# EAGLE design untitled (EAGLE 7.6.0)

## Sheet 1 of 2
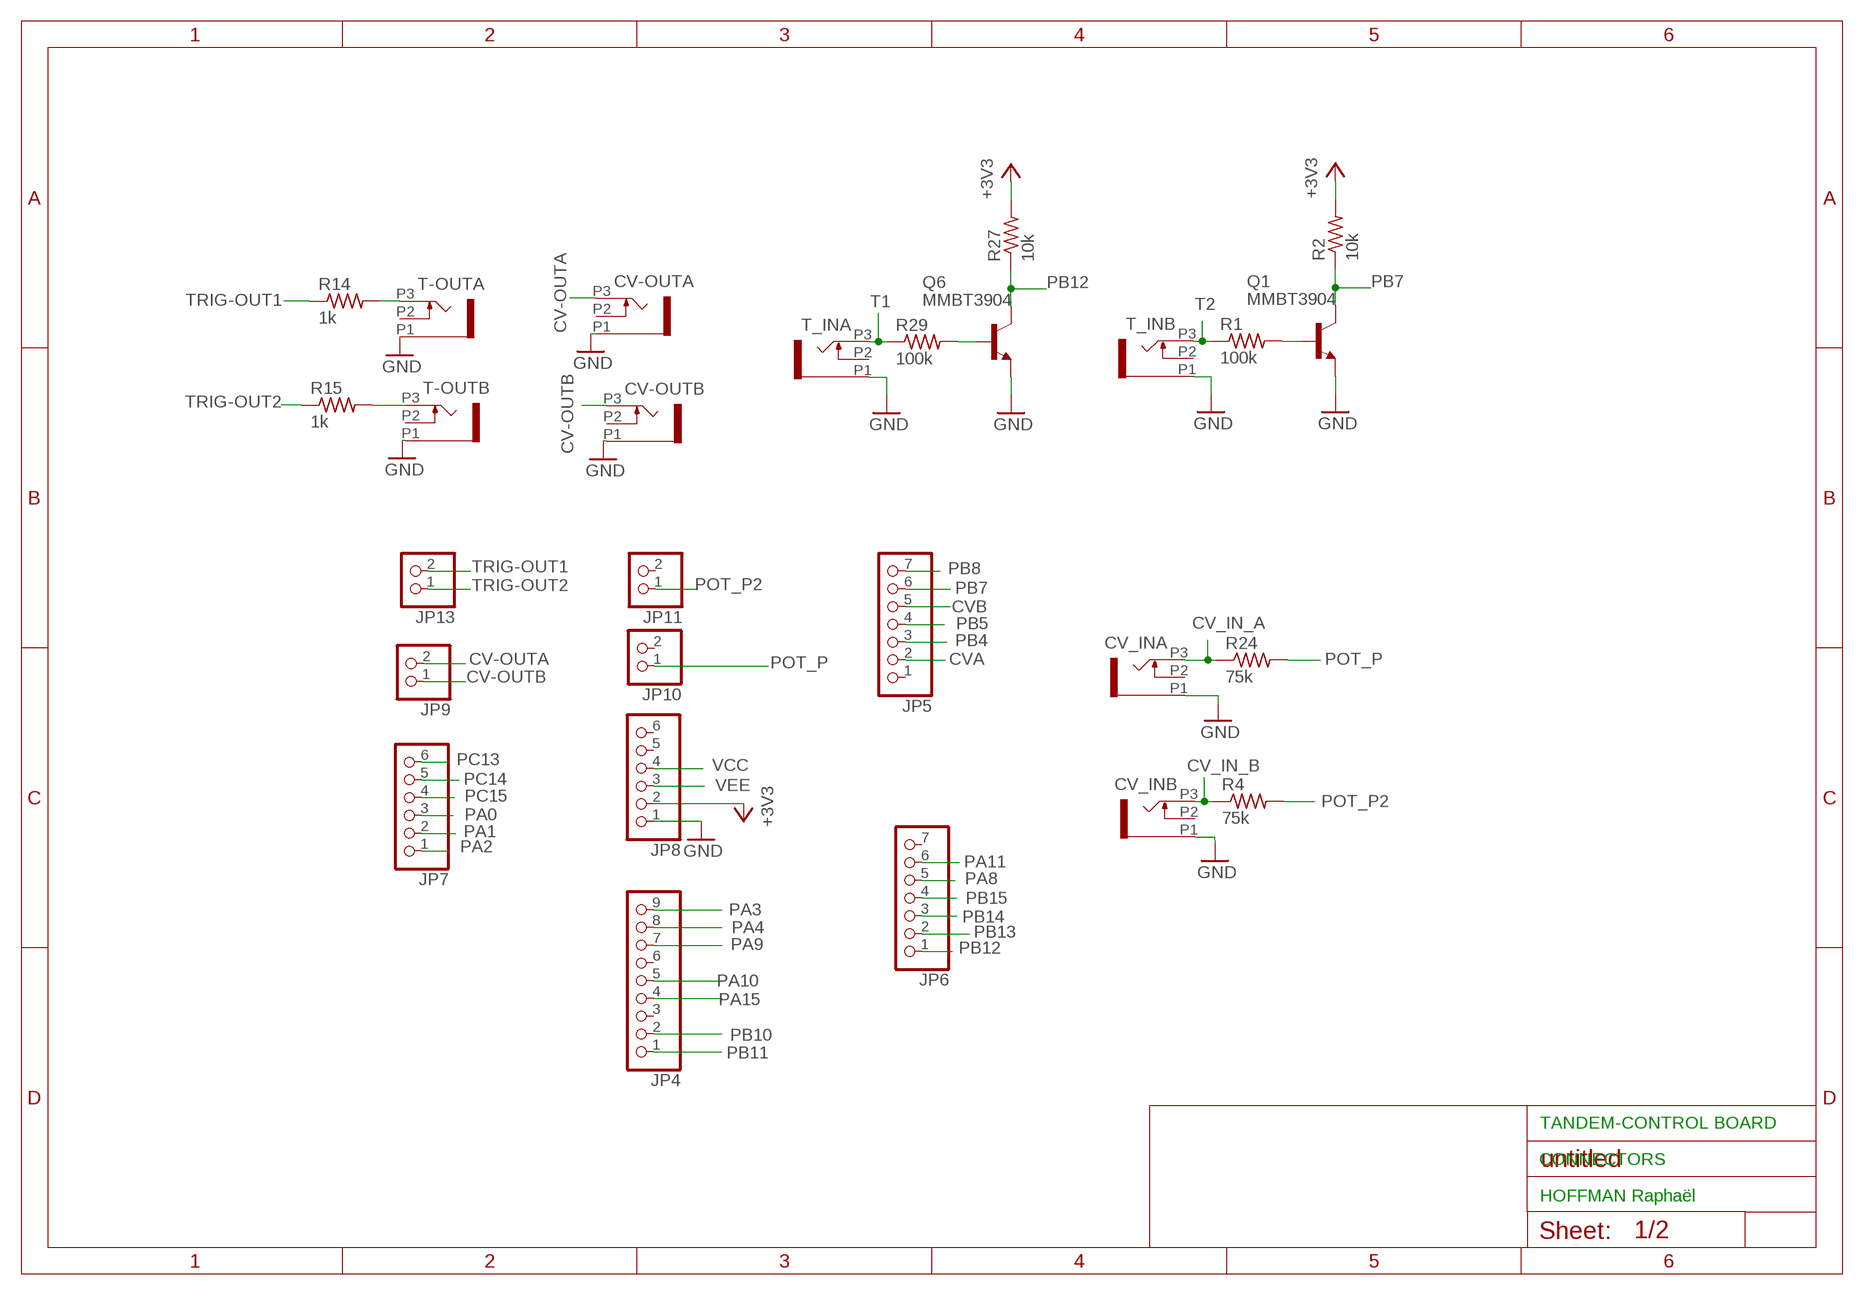
[diagram p0: schematic, sheet 1]

### Parts
CV-OUTA  PJ301_THONKICONN6  [WQP_PJ_301M6]
CV-OUTB  PJ301_THONKICONN6  [WQP_PJ_301M6]
CV_INA  PJ301_THONKICONN6  [WQP_PJ_301M6]
CV_INB  PJ301_THONKICONN6  [WQP_PJ_301M6]
JP4  PINHD-1X9  [1X09-BIG]
JP5  PINHD-1X7  [1X07]
JP6  PINHD-1X7  [1X07]
JP7  PINHD-1X6  [1X06]
JP8  PINHD-1X6  [1X06]
JP9  PINHD-1X2  [1X02]
JP10  PINHD-1X2  [1X02]
JP11  PINHD-1X2  [1X02]
JP13  PINHD-1X2  [1X02]
Q1  MMBT3904  MMBT3904LT1-NPN-SOT23-BEC  [SOT23-BEC]
Q6  MMBT3904  MMBT3904LT1-NPN-SOT23-BEC  [SOT23-BEC]
R1  100k  R-US_R0603  [R0603]
R2  10k  R-US_R0603  [R0603]
R4  75k  R-US_R0603  [R0603]
R14  1k  R-US_R0603  [R0603]
R15  1k  R-US_R0603  [R0603]
R24  75k  R-US_R0603  [R0603]
R27  10k  R-US_R0603  [R0603]
R29  100k  R-US_R0603  [R0603]
T-OUTA  PJ301_THONKICONN6  [WQP_PJ_301M6]
T-OUTB  PJ301_THONKICONN6  [WQP_PJ_301M6]
T_INA  PJ301_THONKICONN6  [WQP_PJ_301M6]
T_INB  PJ301_THONKICONN6  [WQP_PJ_301M6]

### Nets
+3V3: JP8.2 R2.2 R27.2 ; also sheet 2
CV-OUTA: CV-OUTA.P3 JP9.2
CV-OUTB: CV-OUTB.P3 JP9.1
CV_IN_A: CV_INA.P3 R24.1 ; also sheet 2
CV_IN_B: CV_INB.P3 R4.1 ; also sheet 2
CVA: JP5.2 ; also sheet 2
CVB: JP5.5 ; also sheet 2
GND [supply]: CV-OUTA.P1 CV-OUTB.P1 CV_INA.P1 CV_INB.P1 JP8.1 Q1.E Q6.E T-OUTA.P1 T-OUTB.P1 T_INA.P1 T_INB.P1 ; also sheet 2
N$2: Q1.B R1.2
N$10: R14.2 T-OUTA.P3
N$15: R15.2 T-OUTB.P3
N$66: Q6.B R29.2
PA0: JP7.3 ; also sheet 2
PA1: JP7.2 ; also sheet 2
PA2: JP7.1 ; also sheet 2
PA3: JP4.9
PA4: JP4.8 ; also sheet 2
PA8: JP6.5 ; also sheet 2
PA9: JP4.7 ; also sheet 2
PA10: JP4.5 ; also sheet 2
PA11: JP6.6 ; also sheet 2
PA15: JP4.4 ; also sheet 2
PB4: JP5.3 ; also sheet 2
PB5: JP5.4 ; also sheet 2
PB7: JP5.6 Q1.C R2.1
PB8: JP5.7 ; also sheet 2
PB10: JP4.2 ; also sheet 2
PB11: JP4.1 ; also sheet 2
PB12: JP6.1 Q6.C R27.1
PB13: JP6.2 ; also sheet 2
PB14: JP6.3 ; also sheet 2
PB15: JP6.4 ; also sheet 2
PC13: JP7.6 ; also sheet 2
PC14: JP7.5 ; also sheet 2
PC15: JP7.4 ; also sheet 2
POT_P: JP10.1 R24.2
POT_P2: JP11.1 R4.2
T1: R29.1 T_INA.P3 ; also sheet 2
T2: R1.1 T_INB.P3 ; also sheet 2
TRIG-OUT1: JP13.2 R14.1 ; also sheet 2
TRIG-OUT2: JP13.1 R15.1 ; also sheet 2
VCC: JP8.4 ; also sheet 2
VEE: JP8.3 ; also sheet 2
Unconnected: CV-OUTA.P2 CV-OUTB.P2 CV_INA.P2 CV_INB.P2 JP4.3 JP4.6 JP5.1 JP6.7 JP8.5 JP8.6 JP10.2 JP11.2 T-OUTA.P2 T-OUTB.P2 T_INA.P2 T_INB.P2

### Notes on the sheet
- TANDEM-CONTROL BOARD
- CONNECTORS
- HOFFMAN Raphaël

## Sheet 2 of 2
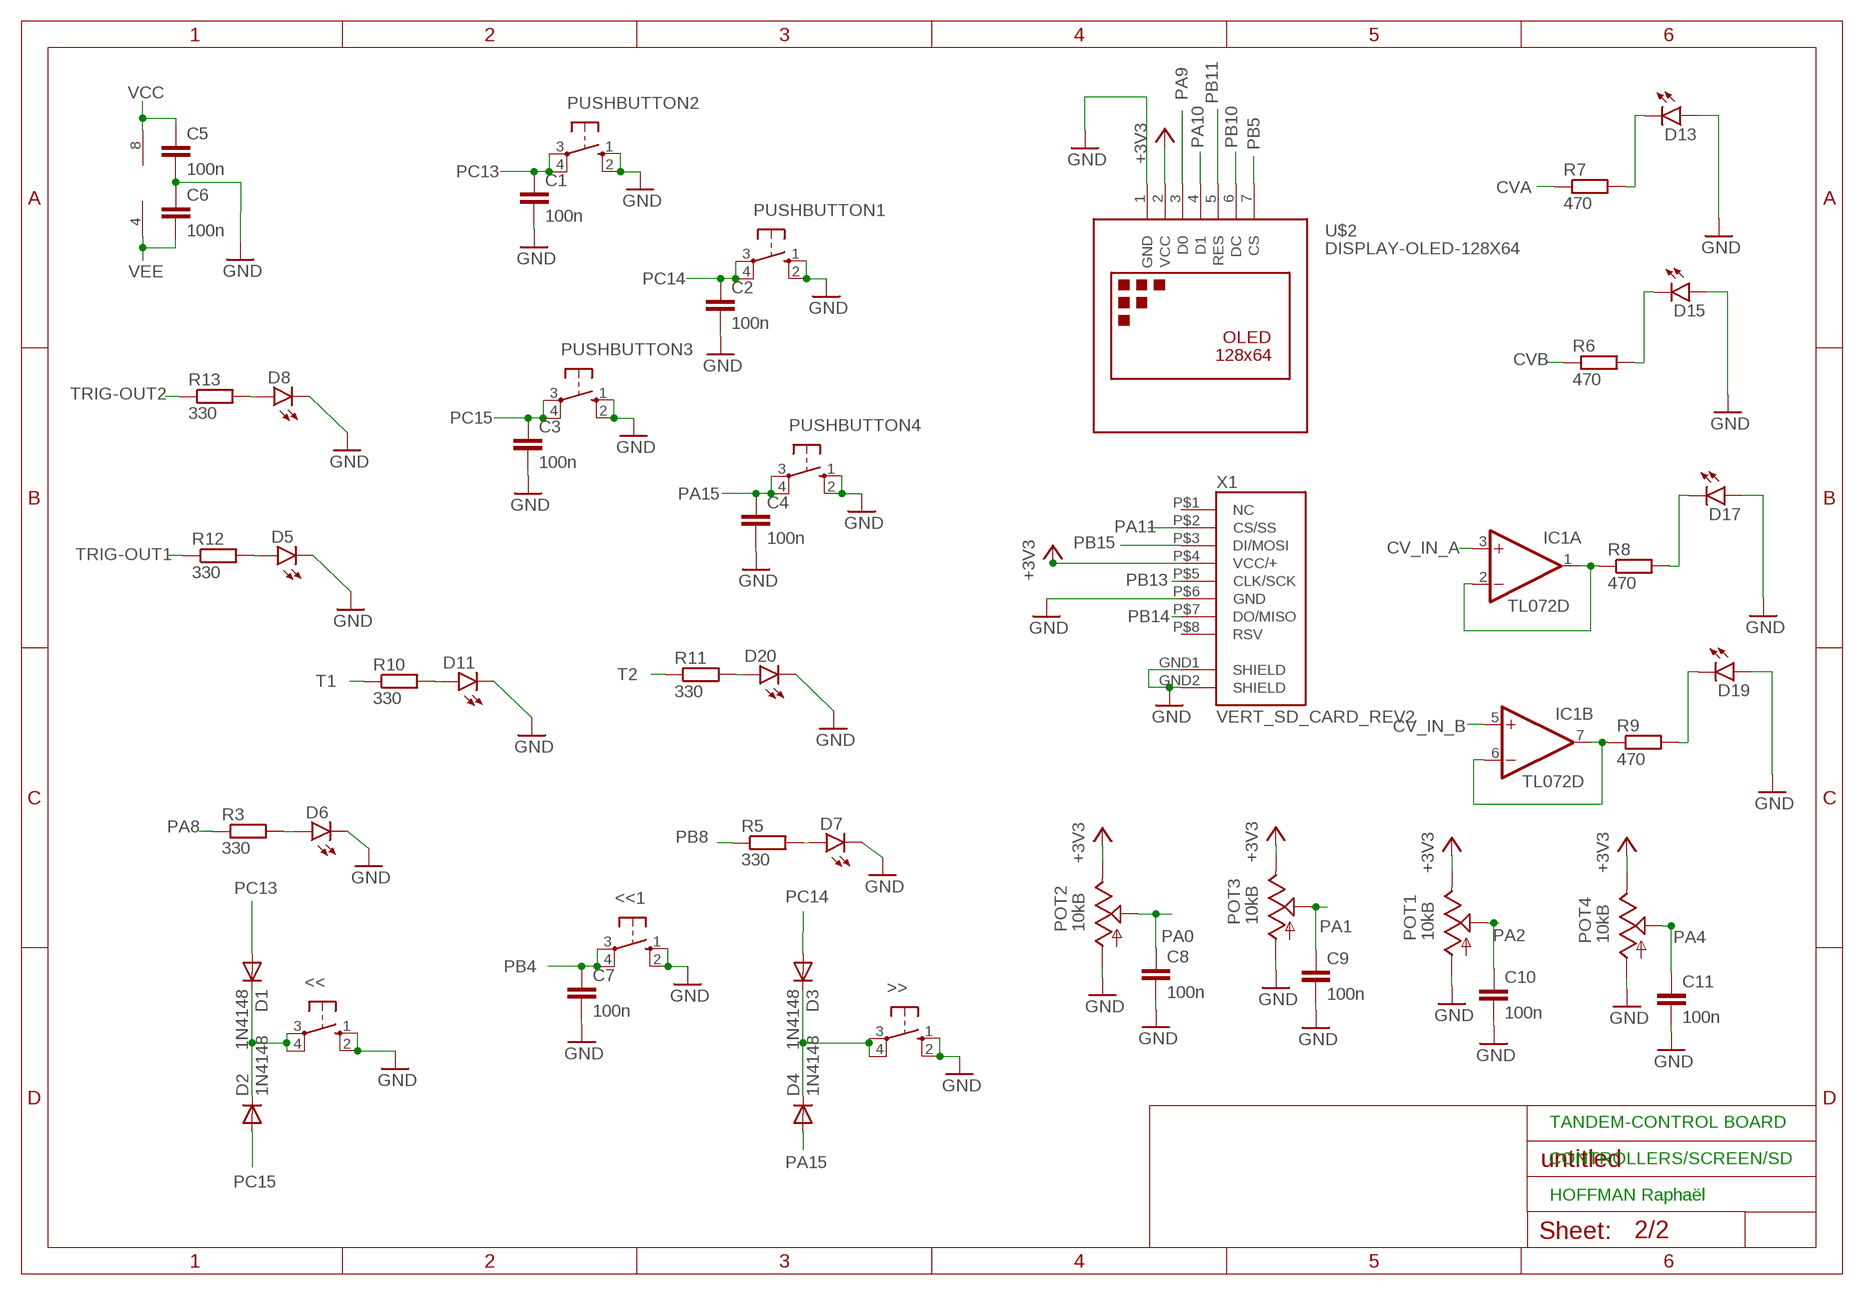
[diagram p1: schematic, sheet 2]

### Parts
<<  10-XX  [B3F-10XX]
<<1  10-XX  [B3F-10XX]
>>  10-XX  [B3F-10XX]
C1  100n  C-EUC0603  [C0603]
C2  100n  C-EUC0603  [C0603]
C3  100n  C-EUC0603  [C0603]
C4  100n  C-EUC0603  [C0603]
C5  100n  C-EUC0603  [C0603]
C6  100n  C-EUC0603  [C0603]
C7  100n  C-EUC0603  [C0603]
C8  100n  C-EUC0603  [C0603]
C9  100n  C-EUC0603  [C0603]
C10  100n  C-EUC0603  [C0603]
C11  100n  C-EUC0603  [C0603]
D1  1N4148  1N4148DO35-7  [DO35-7]
D2  1N4148  1N4148DO35-7  [DO35-7]
D3  1N4148  1N4148DO35-7  [DO35-7]
D4  1N4148  1N4148DO35-7  [DO35-7]
D5  LED3MM  [LED3MM]
D6  LED3MM  [LED3MM]
D7  LED3MM  [LED3MM]
D8  LED3MM  [LED3MM]
D11  LED3MM  [LED3MM]
D13  LED3MM  [LED3MM]
D15  LED3MM  [LED3MM]
D17  LED3MM  [LED3MM]
D19  LED3MM  [LED3MM]
D20  LED3MM  [LED3MM]
IC1  TL072D  [SO08]
POT1  10kB  US-EVUF3M  [EVUFXM]
POT2  10kB  US-EVUF3M  [EVUFXM]
POT3  10kB  US-EVUF3M  [EVUFXM]
POT4  10kB  US-EVUF3M  [EVUFXM]
PUSHBUTTON1  10-XX  [B3F-10XX]
PUSHBUTTON2  10-XX  [B3F-10XX]
PUSHBUTTON3  10-XX  [B3F-10XX]
PUSHBUTTON4  10-XX  [B3F-10XX]
R3  330  R-EU_R0603  [R0603]
R5  330  R-EU_R0603  [R0603]
R6  470  R-EU_R0603  [R0603]
R7  470  R-EU_R0603  [R0603]
R8  470  R-EU_R0603  [R0603]
R9  470  R-EU_R0603  [R0603]
R10  330  R-EU_R0603  [R0603]
R11  330  R-EU_R0603  [R0603]
R12  330  R-EU_R0603  [R0603]
R13  330  R-EU_R0603  [R0603]
U$2  DISPLAY-OLED-128X64  [DISPLAY-OLED-128X64]
X1  VERT_SD_CARD_REV2  [VERT_MICROSD_REV2]

### Nets
+3V3: POT1.3(E) POT2.3(E) POT3.3(E) POT4.3(E) U$2.2(VCC) X1.P$4(VCC/+) ; also sheet 1
CV_IN_A: IC1.3(A:+IN) ; also sheet 1
CV_IN_B: IC1.5(B:+IN) ; also sheet 1
CVA: R7.1 ; also sheet 1
CVB: R6.1 ; also sheet 1
DD: >>.3(P) >>.4(P1) D3.C D4.C
DDD: <<.3(P) <<.4(P1) D1.C D2.C
GND [supply]: <<1.1(S) <<1.2(S1) <<.1(S) <<.2(S1) >>.1(S) >>.2(S1) C1.2 C2.2 C3.2 C4.2 C5.2 C6.1 C7.2 C8.2 C9.2 C10.2 C11.2 D5.K(C) D6.K(C) D7.K(C) D8.K(C) D11.K(C) D13.A D15.A D17.A D19.A D20.K(C) POT1.1(A) POT2.1(A) POT3.1(A) POT4.1(A) PUSHBUTTON1.1(S) PUSHBUTTON1.2(S1) PUSHBUTTON2.1(S) PUSHBUTTON2.2(S1) PUSHBUTTON3.1(S) PUSHBUTTON3.2(S1) PUSHBUTTON4.1(S) PUSHBUTTON4.2(S1) U$2.1(GND) X1.GND1(SHIELD) X1.GND2(SHIELD) X1.P$6(GND) ; also sheet 1
N$1: D20.A R11.2
N$3: D11.A R10.2
N$4: D5.A R12.2
N$5: D6.A R3.2
N$6: D15.K(C) R6.2
N$7: D7.A R5.2
N$8: D8.A R13.2
N$9: D13.K(C) R7.2
N$11: D17.K(C) R8.2
N$12: IC1.1(A:OUT) IC1.2(A:-IN) R8.1
N$13: D19.K(C) R9.2
N$14: IC1.6(B:-IN) IC1.7(B:OUT) R9.1
PA0: C8.1 POT2.2(S) ; also sheet 1
PA1: C9.1 POT3.2(S) ; also sheet 1
PA2: C10.1 POT1.2(S) ; also sheet 1
PA4: C11.1 POT4.2(S) ; also sheet 1
PA8: R3.1 ; also sheet 1
PA9: U$2.3(D0) ; also sheet 1
PA10: U$2.4(D1) ; also sheet 1
PA11: X1.P$2(CS/SS) ; also sheet 1
PA15: C4.1 D4.A PUSHBUTTON4.3(P) PUSHBUTTON4.4(P1) ; also sheet 1
PB4: <<1.3(P) <<1.4(P1) C7.1 ; also sheet 1
PB5: U$2.7(CS) ; also sheet 1
PB8: R5.1 ; also sheet 1
PB10: U$2.6(DC) ; also sheet 1
PB11: U$2.5(RES) ; also sheet 1
PB13: X1.P$5(CLK/SCK) ; also sheet 1
PB14: X1.P$7(DO/MISO) ; also sheet 1
PB15: X1.P$3(DI/MOSI) ; also sheet 1
PC13: C1.1 D1.A PUSHBUTTON2.3(P) PUSHBUTTON2.4(P1) ; also sheet 1
PC14: C2.1 D3.A PUSHBUTTON1.3(P) PUSHBUTTON1.4(P1) ; also sheet 1
PC15: C3.1 D2.A PUSHBUTTON3.3(P) PUSHBUTTON3.4(P1) ; also sheet 1
T1: R10.1 ; also sheet 1
T2: R11.1 ; also sheet 1
TRIG-OUT1: R12.1 ; also sheet 1
TRIG-OUT2: R13.1 ; also sheet 1
VCC: C5.1 IC1.8(P:V+) ; also sheet 1
VEE: C6.2 IC1.4(P:V-) ; also sheet 1
Unconnected: X1.P$1(NC) X1.P$8(RSV)

### Notes on the sheet
- TANDEM-CONTROL BOARD
- CONTROLLERS/SCREEN/SD
- HOFFMAN Raphaël

## Library data of the parts
<< <<1 >> PUSHBUTTON1-PUSHBUTTON4 = switch-omron:10-XX: OMRON SWITCH; MPN: B3F-1000; OC_FARNELL: 176432; OC_NEWARK: 36M3542
C1-C11 = rcl:C-EU: CAPACITOR, European symbol
CV-OUTA CV-OUTB CV_INA CV_INB T-OUTA T-OUTB T_INA T_INB = og-pj301:PJ301_THONKICONN
D1-D4 = diode:1N4148: DIODE high speed (Philips)
D5-D8 D11 D13 D15 D17 D19 D20 = gm-diodes:LED
IC1 = linear:TL072: OP AMP
JP4 = adafruit:PINHD-1X9: Pin header 1x10 0.1" spacing With round pins
JP5 JP6 = pinhead:PINHD-1X7: PIN HEADER
JP7 JP8 = pinhead:PINHD-1X6: PIN HEADER
JP9-JP11 JP13 = pinhead:PINHD-1X2: PIN HEADER
POT1-POT4 = pot:US-EVU: 9 mm Square Rotary Potentiometers Source: Panasonic
Q1 Q6 = transistor:*-NPN-: NPN Transistror BF959 corrected 2008.03.06
R1 R2 R4 R14 R15 R24 R27 R29 = rcl:R-US_: RESISTOR, American symbol
R3 R5-R13 = rcl:R-EU_: RESISTOR, European symbol
U$2 = diy-modules:DISPLAY-OLED-128X64: 128x64 Dot Matrix OLED Module based on SSD1306 chip Variant with SPI interface More details available here: http://www.instructables.com/id/How-to-use-OLED-display-arduino-module/ SSD1306 datasheet: https://cdn-shop.adafruit.com/datasheets/SSD1306.pdf Click here to find device on ebay.com <http://www.ebay.com/sch/oled+display+128x64> Note: There are two variants: I2C and SPI. Search for the proper version.
X1 = TomW:VERT_SD_CARD_REV2

## Net classes
0 default: width 0.305 mm
1 supply: width 0.6 mm, drill 0.6 mm, clearance 0.28 mm
2 ground: width 0.457 mm

## Board
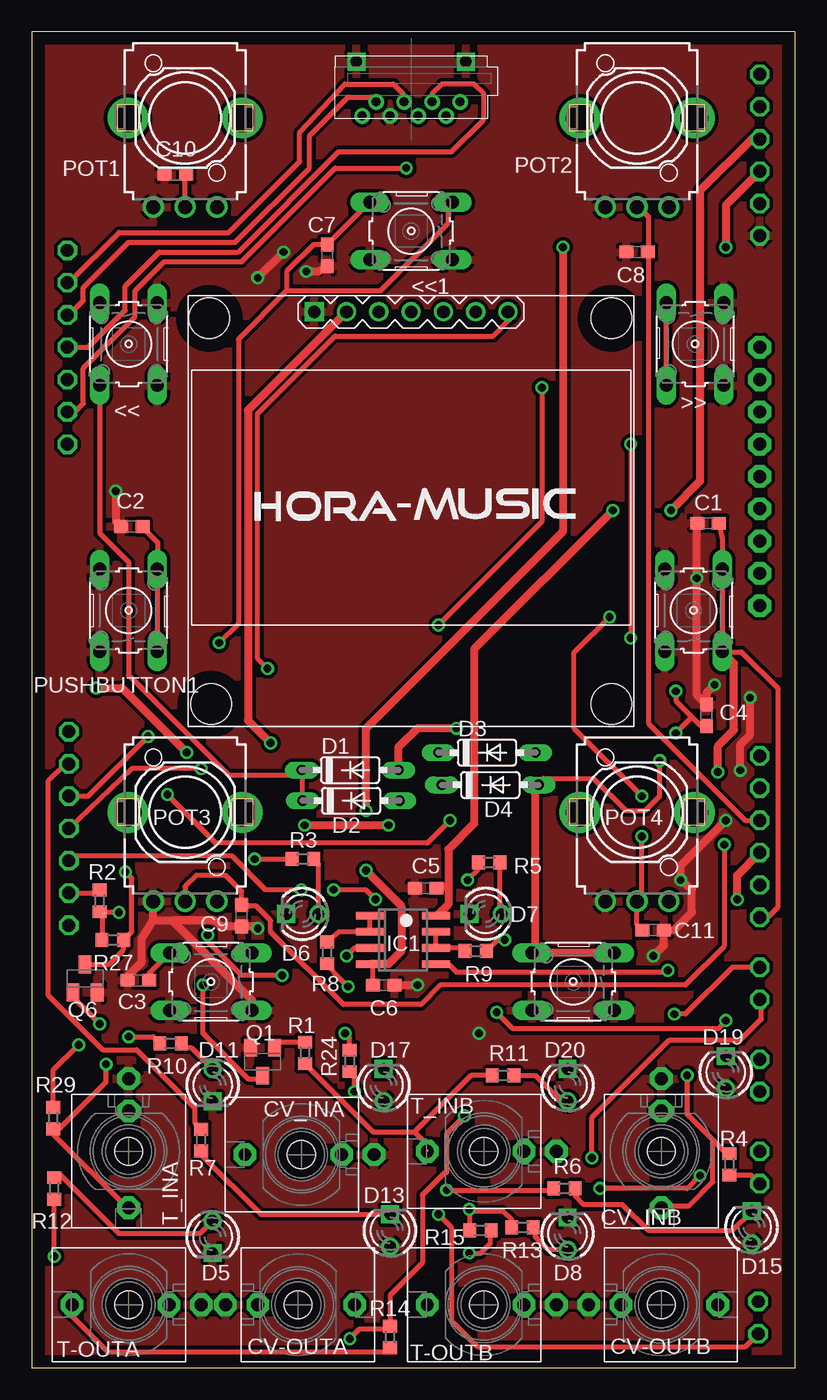
[diagram p2: board, top side]
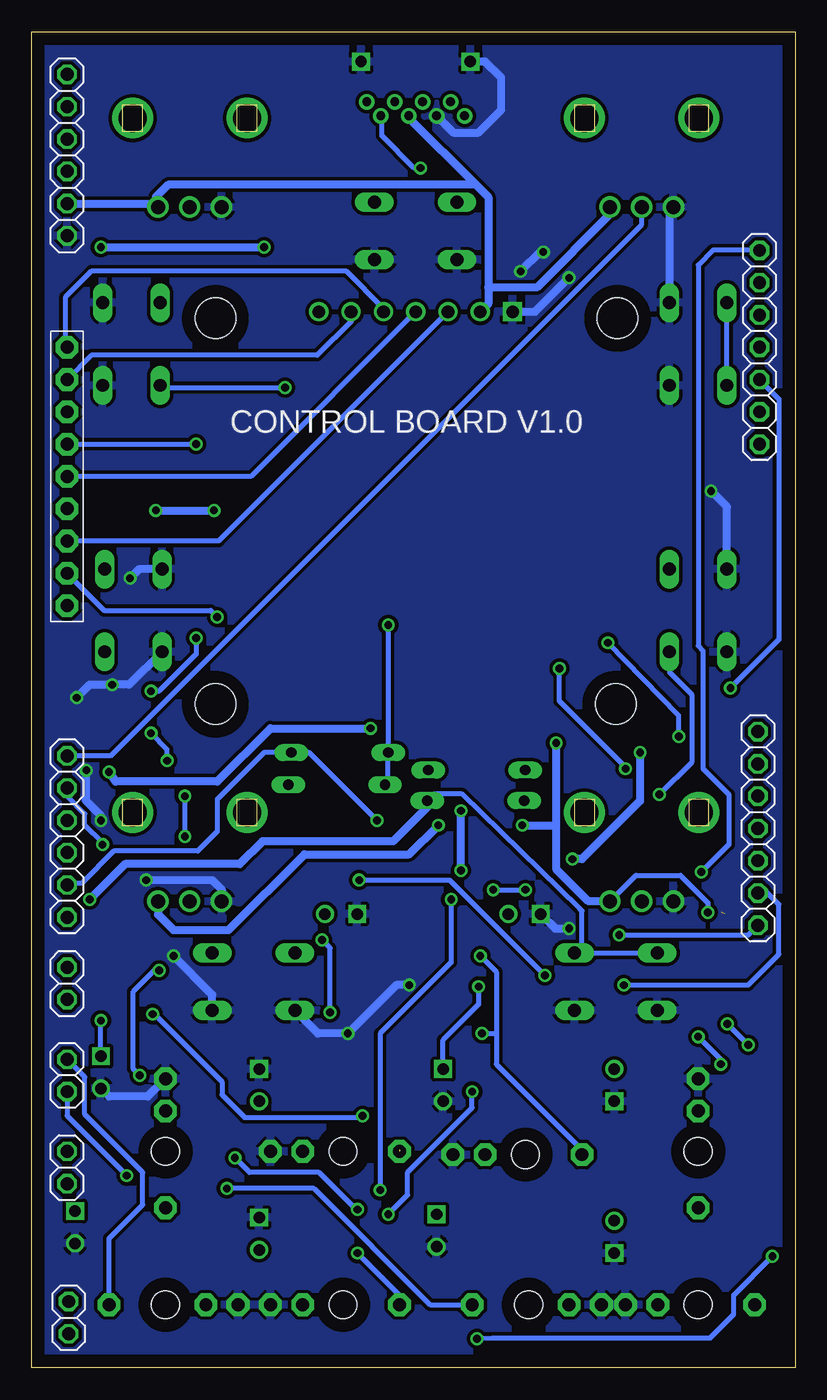
[diagram p3: board, bottom side, seen from below]

Size 60.05 x 105.08 mm. Coordinates in mm from the lower left corner, seen from the top.
Outline: 0,0 60.05,0 60.05,105.08 0,105.08 0,0
Copper layers (1*16): Top 0.035mm / dielectric 1.5mm / Bottom 0.035mm
Design rules "default *": minimum track width 10mil, minimum drill 24mil, track to track 8mil, track to pad 8mil, pad to pad 8mil, via to via 8mil, smd to smd 8mil, copper to edge 40mil, drill to drill 8mil, minimum pad ring 10mil, minimum via ring 8mil, stop-mask expansion 4mil, vias tented up to drill 0mil, thermal gap 10mil
Holes 3.2 mm at 14.1,52.2 45.59,52.2 13.97,82.55 45.59,82.55

### Footprints (pad centres in the part's own frame; a part is rotated, then mirrored left to right if it is on the bottom)
B3F-10XX = drill 1.016 long: 1 -3.251,2.261; 2 3.251,2.261; 3 -3.251,-2.261; 4 3.251,-2.261
C0603 = smd 1.1 x 1: 1 -0.85,0; 2 0.85,0
WQP_PJ_301M6 = drill 1.016 pad 1.778 octagon: P1 0,-5.715; P2 0,-3.175; P3 0,4.445 | hole 2.2: 0,0
DO35-7 = drill 0.813 long: A 3.81,0; C -3.81,0
LED3MM = drill 0.9: A -1.27,0 | drill 0.9 square: K 1.27,0
SO08 = smd 0.6 x 2.2: 1 -1.905,-2.6; 2 -0.635,-2.6; 3 0.635,-2.6; 4 1.905,-2.6; 5 1.905,2.6; 6 0.635,2.6; 7 -0.635,2.6; 8 -1.905,2.6
1X09-BIG = drill 1.016 pad 1.778 octagon: 1 -10.16,0; 2 -7.62,0; 3 -5.08,0; 4 -2.54,0; 5 0,0; 6 2.54,0; 7 5.08,0; 8 7.62,0; 9 10.16,0
1X07 = drill 1.016 octagon: 1 -7.62,0; 2 -5.08,0; 3 -2.54,0; 4 0,0; 5 2.54,0; 6 5.08,0; 7 7.62,0
1X06 = drill 1.016 octagon: 1 -6.35,0; 2 -3.81,0; 3 -1.27,0; 4 1.27,0; 5 3.81,0; 6 6.35,0
1X02 = drill 1.016 octagon: 1 -1.27,0; 2 1.27,0
EVUFXM = drill 1.1 pad 1.676: 1 -2.5,-7; 2 0,-7; 3 2.5,-7 | drill 2.2 pad 3.048: M1 4.5,0; M2 -4.5,0
SOT23-BEC = smd 1 x 1.4: B -0.95,-1.1; C 0,1.1; E 0.95,-1.1
R0603 = smd 1 x 1.1: 1 -0.85,0; 2 0.85,0
DISPLAY-OLED-128X64 = drill 1 square: 1 -7.62,12.7 | drill 1: 2 -5.08,12.7; 3 -2.54,12.7; 4 0,12.7; 5 2.54,12.7; 6 5.08,12.7; 7 7.62,12.7
VERT_MICROSD_REV2 = drill 0.9 square: GND1 -4.3,-3.17; GND2 4.3,-3.17 | drill 0.7: P$1 -3.85,0; P$2 -2.75,1.1; P$3 -1.65,0; P$4 -0.55,1.1; P$5 0.55,0; P$6 1.65,1.1; P$7 2.75,0; P$8 3.85,1.1

### Placement (x,y rotation side)
<<  7.62,80.52 270 top
<<1  29.84,89.41 180 top
>>  52.2,80.52 270 top
C1  53.21,66.42 180 top
C2  7.87,66.17 180 top
C3  8.38,30.48 180 top
C4  53.09,51.31 90 top
C5  30.99,37.72 180 top
C6  27.69,30.1 180 top
C7  23.24,87.5 270 top
C8  47.62,87.76 180 top
C9  16.51,35.56 270 top
C10  11.3,93.85 180 top
C11  48.9,34.42 0 top
CV-OUTA  20.95,4.95 270 top
CV-OUTB  49.53,4.95 270 top
CV_INA  21.21,16.76 90 top
CV_INB  49.53,17.02 180 top
D1  25.04,47.02 0 top
D2  25.12,44.6 0 top
D3  35.81,48.39 0 top
D4  36.07,45.85 0 top
D5  14.22,10.29 270 top
D6  21.29,35.69 180 top
D7  35.71,35.69 180 top
D8  42.16,10.54 90 top
D11  14.22,22.22 270 top
D13  28.19,10.79 90 top
D15  56.64,11.05 90 top
D17  27.69,22.22 90 top
D19  54.61,23.24 90 top
D20  42.16,22.22 90 top
IC1  29.21,33.66 270 top
JP4  57.28,70.1 270 bottom
JP5  2.92,42.42 270 bottom
JP6  2.79,80.26 270 bottom
JP7  57.28,41.78 270 bottom
JP8  57.28,95.38 90 bottom
JP9  57.28,22.99 270 bottom
JP10  57.15,3.94 90 bottom
JP11  57.28,15.75 90 bottom
JP13  57.28,30.23 90 bottom
POT1  12.06,98.3 0 top
POT2  47.62,98.3 0 top
POT3  12.06,43.69 0 top
POT4  47.62,43.69 0 top
PUSHBUTTON1  7.62,59.56 90 top
PUSHBUTTON2  52.07,59.56 90 top
PUSHBUTTON3  14.1,30.35 180 top
PUSHBUTTON4  42.6,30.35 180 top
Q1  18.16,24.08 180 top
Q6  4.19,30.63 0 top
R1  21.49,24.77 90 top
R2  5.36,36.73 270 top
R3  21.34,40.01 0 top
R4  54.86,16 270 top
R5  35.99,39.75 0 top
R6  41.91,14.1 0 top
R7  13.34,17.91 270 top
R8  23.24,32.64 270 top
R9  34.92,32.77 0 top
R10  10.92,25.53 0 top
R11  37.08,22.99 0 top
R12  1.78,14.1 90 top
R13  38.61,11.05 0 top
R14  28.19,2.41 270 top
R15  35.31,10.79 0 top
R24  25.02,24.13 270 top
R27  6.38,33.66 180 top
R29  1.7,19.63 90 top
T-OUTA  7.62,4.95 90 top
T-OUTB  35.56,4.95 90 top
T_INA  7.62,17.02 180 top
T_INB  35.56,17.02 90 top
U$2  29.84,70.36 0 top
X1  29.84,99.57 180 top

### Tracks (layer width: path | path; a pad name or v marks a point on that pad's centre or on a via)
+3V3  (via drill 0.61)  (1 unrouted)
  Top 0.406: v6.86,35.81 5.8,35.81 | R2.2 5.53,35.71 R27.2
  Top 0.61: U$2.2 17.02,75.31 17.02,50.93 v18.8,49.15 | v28.07,42.67 v21.46,42.67
  Bottom 0.406: 50.39,91.57 50.29,91.47 POT2.3 | POT3.3 12.52,38.73 9.02,38.73 6.86,36.58 v6.86,35.81
  Bottom 0.61: POT1.3 14.56,90.72 20.32,84.96 24.13,84.96 | 24.13,84.96 24.13,83.69 U$2.2 | X1.P$4 30.39,98.34 25.15,93.09 | 25.15,93.09 24.13,92.08 24.13,84.96 | 50.29,91.47 50.29,92.08 49.28,93.09 25.15,93.09 | JP8.2 50.39,91.57 | v18.8,49.15 18.8,42.67 | 18.8,42.67 18.8,39.24 16.24,36.69 POT3.3 | POT4.3 50.12,35.65 48.9,34.42 44.58,34.42 38.61,40.39 30.35,40.39 v28.07,42.67 | v21.46,42.67 18.8,42.67
CV-OUTA  (via drill 0.61)
  Top 0.406: v52.58,15.11 51.56,14.1 v44.7,14.1
  Bottom 0.406: JP9.2 57.28,19.81 v52.58,15.11 | CV-OUTA.P3 28.7,4.95 37.85,14.1 v44.7,14.1
CV-OUTB
  Bottom 0.406: JP9.1 55.88,22.86 55.88,19.94 51.31,15.37 51.31,12.83 53.98,10.16 CV-OUTB.P3
CV_IN_A  (via drill 0.61)
  Top 0.406: IC1.3 25.4,33.02 v24.77,32.38 | R24.1 25.02,25.91 v24.64,26.29
  Bottom 0.406: v24.77,32.38 23.5,31.11 23.5,26.29 | 23.5,26.29 23.5,23.88 16.76,17.14 CV_INA.P3 | v24.64,26.29 23.5,26.29
CV_IN_B  (via drill 0.61)
  Top 0.406: CV_INB.P3 49.62,12.74 51.73,12.74 53.59,14.61 53.59,17.91 | IC1.5 32.77,31.75 33.4,31.11 49.91,31.11 v50.04,31.24 | 53.59,17.91 54.65,16.85 R4.1 | v51.56,22.99 51.56,19.94 53.47,18.03 53.59,17.91
  Bottom 0.406: v50.04,31.24 50.42,31.24 52.07,29.59 52.07,23.5 v51.56,22.99
CVA
  Top 0.406: JP5.2 2.67,47.5 1.27,46.1 1.27,29.34 5.59,25.02 8.26,25.02 12.83,20.45 12.83,19.27 R7.1
CVB  (via drill 0.61)
  Top 0.406: v27.05,36.83 26.29,37.59 v23.75,37.59 | v21.21,37.59 18.41,37.59 15.75,40.26 3.3,40.26 JP5.5 | v32.64,13.97 40.93,13.97 R6.1
  Bottom 0.406: v27.05,36.83 27.05,31.88 32.64,26.29 v32.64,13.97 | v23.75,37.59 v21.21,37.59
DD  (via drill 0.61)
  Top 0.406: >>.4 >>.3 | v40.13,77.09 40.13,66.55 v32,58.42
  Bottom 0.406: >>.4 49.76,77.09 v40.13,77.09 | v32,58.42 D3.C 32,46.1 D4.C
DDD
  Top 0.406: <<.4 5.36,65.63 7.62,63.37 7.62,54.48 15.49,46.61 20.83,46.61 D1.C 21.31,46.94 D2.C
  Bottom 0.406: <<.4 <<.3
GND  (via drill 0.61)
  Top 0.61: v17.78,85.73 v19.81,87.76 | v21.59,86.23 22.57,86.23 C7.2 | v6.6,68.96 6.6,66.59 C2.2 | C1.2 52.32,65.44 v52.32,62.1 52.32,52.92 C4.2 53.09,53.09 v53.72,53.72 | POT4.1 45,36.56 45.1,36.56 | C6.1 v30.35,30.1 | v48.9,32.38 49.74,33.23 C11.2 50.55,34.42 51.94,35.81 51.94,37.59 v51.05,38.35 51.05,39.5 v54.61,43.05 | v55.75,46.99 55.75,49.02 56.52,49.78 v56.52,52.71 | v17.78,34.54 17.61,34.71 C9.2 14.95,34.71 14.35,35.18 11.05,35.18 | PUSHBUTTON3.1 17.35,28.88 11.05,35.18 | C3.2 7.53,30.77 8.6,31.84 8.64,32.09 8.64,33.74 9.56,35.18 | 9.56,35.18 POT3.1 | 9.56,35.18 11.05,35.18
  Bottom 0.61: POT1.1 9.88,90.98 <<.1 | X1.P$6 26.88,97.16 24.89,97.16 23.11,98.93 23.11,101.47 24.38,102.74 X1.GND2 | PUSHBUTTON2.1 52.4,53.72 v53.72,53.72 55.5,53.72 v56.52,52.71 | U$2.1 20.45,83.06 v17.78,85.73 | v19.81,87.76 20.07,87.76 v21.59,86.23 | PUSHBUTTON1.2 5.36,67.72 v6.6,68.96 | PUSHBUTTON2.2 51.61,62.81 v52.32,62.1 | 44.94,36.69 POT4.1 45.09,36.73 45.09,37.59 45.85,38.35 v51.05,38.35 | PUSHBUTTON4.2 37.54,26.29 v35.18,26.29 31.37,30.1 v30.35,30.1 | PUSHBUTTON4.1 45.85,29.34 v48.9,32.38 | v55.75,46.99 55.75,44.58 54.61,43.43 v54.61,43.05 | CV_INB.P1 50.93,21.34 53.98,21.34 D19.A | D6.K 18.87,34.54 v17.78,34.54
  pour Top: 0,105.28 60.33,105.28 60.33,-0.13 0,-0.13
  pour Bottom: -0.25,105.28 60.33,105.28 60.33,-0.13 0,-0.13
N$1
  Top 0.406: R11.2 39.62,22.99 41.66,20.95 D20.A
N$2
  Top 0.406: Q1.B 19.55,25.61 R1.2
N$3
  Top 0.406: R10.2 11.77,25.18 12.53,25.18 D11.A
N$4
  Top 0.406: D5.A 13.21,10.54 6.86,10.54 2.2,15.2 R12.2
N$5
  Top 0.406: D6.A 22.55,39.64 R3.2
N$6
  Top 0.406: R6.2 42.76,13.5 43.43,12.83 46.48,12.83 48.51,10.79 55.12,10.79 D15.K
N$7
  Top 0.406: D7.A 36.84,35.83 R5.2
N$8
  Top 0.406: D8.A 40.64,9.27 39.62,10.29 39.62,10.88 R13.2
N$9
  Top 0.406: R7.2 13.34,16.76 18.03,12.07 D13.K
N$10
  Top 0.406: R14.2 28.19,1.27 5.97,1.27 3.17,4.06 T-OUTA.P3
N$11  (via drill 0.61)
  Top 0.406: R8.2 23.88,30.99 v24.89,29.97
  Bottom 0.406: v24.89,29.97 24.89,28.57 27.69,25.78 D17.K 27.18,24
N$12
  Top 0.406: IC1.1 IC1.2 24.17,34.29 R8.1
N$13  (via drill 0.61)
  Top 0.406: v36.58,27.94 37.85,26.67 53.98,26.67 v54.61,27.3 | v37.21,33.66 36.66,33.66 R9.2
  Bottom 0.406: v36.58,27.94 36.58,33.02 v37.21,33.66 | D19.K v54.61,27.3
N$14
  Top 0.406: IC1.7 IC1.6 33.82,33.02 R9.1
N$15  (via drill 0.61)
  Top 0.406: v34.42,9.02 35.31,9.02 36.07,9.78 36.07,10.45 R15.2
  Bottom 0.406: T-OUTB.P3 31.11,5.71 v34.42,9.02
N$66  (via drill 0.61)
  Top 0.406: R29.2 1.7,23.42 v3.68,25.4 | v5.33,27.05 3.24,29.14 Q6.B
  Bottom 0.406: v3.68,25.4 v5.33,27.05
PA0
  Top 0.406: C8.1 48.22,87.8 | C8.1 48.51,87.72 48.51,50.67 56.13,43.05 JP7.3 | POT2.2 47.77,91.3 48.51,90.55 48.51,87.8 C8.1
PA1  (via drill 0.61)
  Top 0.406: v54.48,41.15 54.48,33.15 51.44,30.1 32.13,30.1 30.61,28.57 24.51,28.57 18.8,34.29 18.8,35.18 17.65,36.32 17.11,36.32 C9.1 16.51,37.47 15.24,38.73 12.95,38.73 12.06,37.85 POT3.2
  Bottom 0.406: v54.48,41.15 54.48,41.28 55.88,42.67 55.88,43.56 57.28,44.96 JP7.2
PA2
  Top 0.406: POT1.2 12.06,93.69 C10.1
  Bottom 0.406: JP7.1 53.85,48.13 12.06,89.92 POT1.2
PA4  (via drill 0.61)
  Top 0.406: v45.47,59.05 42.67,56.26 42.67,50.29 v48.01,44.96 | v48.01,41.78 48.01,36.96 47.88,36.83 POT4.2 47.62,34.84 C11.1
  Bottom 0.406: JP4.8 54.36,59.56 45.97,59.56 v45.47,59.05 | v48.01,44.96 v48.01,41.78
PA8  (via drill 0.61)
  Top 0.406: v17.53,40.01 R3.1
  Top 0.61: v5.08,53.47 7.11,53.47 v12.19,48.39
  Bottom 0.406: JP6.5 1.27,76.2 1.27,57.28 v5.08,53.47
  Bottom 0.61: v17.53,40.01 16.76,40.01 12.19,44.58 v12.19,48.39
PA9
  Bottom 0.406: U$2.3 45.34,65.02 JP4.7
PA10
  Bottom 0.406: U$2.4 42.8,70.1 JP4.5
PA11  (via drill 0.61)
  Top 0.406: JP6.6 3.43,75.18 4.06,75.82 4.06,78.61 8.13,82.68 8.13,84.71 10.41,87 16.51,87 23.88,94.36 v29.46,94.36
  Bottom 0.406: v29.46,94.36 29.97,94.36 32.51,96.9 32.51,98.39 X1.P$2
PA15  (via drill 0.61)
  Top 0.406: 53.38,50.42 C4.1 53,50.55 52.58,50.55 51.94,51.18 | v47.12,72.64 v47.12,57.4 | v50.67,53.21 50.67,52.45 51.94,51.18 | 39.88,45.97 40.26,46.36 44.2,46.36 46.74,43.82 48.26,43.82 49.4,44.96 v49.4,47.75 | v50.67,49.91 51.94,51.18
  Top 0.61: 39.88,45.97 D4.A 39.62,45.59 39.62,32.89 39.9,32.61 PUSHBUTTON4.3 PUSHBUTTON4.4
  Bottom 0.406: JP4.4 v47.12,72.64 | v47.12,57.4 47.12,56.13 50.04,53.21 v50.67,53.21 | v49.4,47.75 49.4,48.64 v50.67,49.91
PB4  (via drill 0.61)
  Top 0.406: <<1.4 26.56,91.67 C7.1 22.19,88.35 20.07,86.23 20.07,84.71 | 20.07,84.71 27.43,84.71 32.77,90.04 32.77,91.34 <<1.3 | 20.07,84.71 16.26,80.9 16.26,58.55 v14.73,57.02 | JP5.3 4.45,44.96 v9.14,49.66
  Bottom 0.406: v9.14,49.66 9.14,51.31 v14.73,57.02
PB5  (via drill 0.61)
  Top 0.406: v13.34,47.12 7.87,47.12 JP5.4 | v18.54,54.99 17.78,55.75 17.78,75.06 23.88,81.15 36.32,81.15 37.59,82.42 37.59,82.93 U$2.7
  Bottom 0.406: 18.29,55.25 v18.54,54.99 18.54,52.45 13.46,47.37 v13.34,47.12
PB7  (via drill 0.61)
  Top 0.406: JP5.6 5.5,37.34 R2.1 | v13.46,30.1 13.46,26.29 17.02,22.73 17.91,22.73 Q1.C
  Bottom 0.406: v13.46,30.1 3.68,30.1 1.27,32.51 1.27,36.45 2.29,37.47 2.79,37.47 JP5.6
PB8  (via drill 0.61)
  Top 0.406: R5.1 35.14,39.21 v34.29,38.35 | v19.68,30.86 16.51,30.86 13.84,33.53 v13.84,34.04
  Bottom 0.406: v34.29,38.35 27.18,38.35 v19.68,30.86 | v13.84,34.04 3.68,34.04 JP5.7
PB10
  Bottom 0.406: U$2.6 34.92,82.3 37.59,79.63 55.37,79.63 JP4.2
PB11
  Bottom 0.406: U$2.5 32.38,83.31 35.31,86.23 55.37,86.23 57.4,84.2 57.4,80.39 JP4.1
PB12  (via drill 0.61)
  Top 0.406: v7.37,38.99 7.86,38.5 7.86,34.29 R27.1 7.22,32.88 6.08,31.73 Q6.C
  Bottom 0.406: JP6.1 6.48,87.88 7.62,86.74 7.62,56.77 7.24,56.39 7.24,47.12 5.21,45.09 5.21,41.15 v7.37,38.99
PB13
  Top 0.406: X1.P$5 29.21,99.65 29.21,100.2 28.45,100.97 24.64,100.97 21.08,97.16 21.08,94.87 15.49,89.28 6.86,89.28 2.92,85.34 JP6.2
PB14
  Top 0.406: X1.P$7 26.71,99.95 24.89,99.95 21.84,96.9 21.84,94.36 16,88.52 7.62,88.52 4.06,84.96 4.06,83.95 2.92,82.8 JP6.3
PB15
  Top 0.406: X1.P$3 31.5,100.2 32.26,100.97 34.8,100.97 35.56,100.2 35.56,98.17 33.02,95.63 24.13,95.63 16.26,87.76 10.03,87.76 7.37,85.09 7.37,83.19 4.45,80.26 JP6.4
PC13  (via drill 0.61)
  Top 0.406: C1.1 54.33,65.14 PUSHBUTTON2.4 PUSHBUTTON2.3 55.83,56.31 58.67,53.47 58.67,36.2 57.91,35.43 JP7.6
  Top 0.61: PUSHBUTTON2.3 55.24,55.4 55.24,50.17 53.98,48.9 v53.98,46.86 | v33.4,50.29 30.35,50.29 28.83,48.77 28.83,47.04 D1.A
  Bottom 0.61: v33.4,50.29 41.27,50.29 45.47,46.1 53.47,46.1 v53.98,46.86
PC14  (via drill 0.61)
  Top 0.406: C2.1 8.72,66.08 9.91,64.9 9.91,62.84 PUSHBUTTON1.4 PUSHBUTTON1.3 | v10.67,45.09 14.48,41.28 31.11,41.28 v32.89,43.05
  Bottom 0.406: PUSHBUTTON1.3 9.88,54.71 8.13,52.96 8.13,47.62 v10.67,45.09 | v32.89,43.05 38.23,48.39 D3.A 41.78,48.39 45.47,44.7 45.47,42.16 46.99,40.64 53.59,40.64 56.13,38.1 57.15,38.1 JP7.5
PC15  (via drill 0.61)
  Top 0.406: JP7.4 57.15,40.51 | C3.1 9.23,31 PUSHBUTTON3.4
  Top 0.61: v55.5,36.83 55.5,38.73 JP7.4
  Bottom 0.406: PUSHBUTTON3.4 PUSHBUTTON3.3 16.76,33.2 16.76,35.94 16.97,36.14 26.19,45.11 28.42,45.11 D2.A
  Bottom 0.61: D2.A 28.93,44.09 31.62,41.4 41.91,41.4 43.69,39.62 52.7,39.62 v55.5,36.83
POT_P  (via drill 0.61)
  Top 0.406: v25.4,21.72 25.4,22.9 R24.2 | JP10.1 56.13,1.65 35.05,1.65 33.02,3.68 33.02,11.05 v32,12.07
  Bottom 0.406: v25.4,21.72 25.4,20.45 30.48,15.37 30.48,13.59 v32,12.07
POT_P2
  Top 0.406: JP11.1 56.6,15.15 R4.2
T1  (via drill 0.61)
  Top 0.406: v5.84,23.88 5.84,22.48 2.15,18.78 R29.1 1.7,18.36 7.49,12.57 T_INA.P3 | v7.62,26.04 9.56,26.04 R10.1
  Bottom 0.406: v5.84,23.88 5.84,24.26 v7.62,26.04
T2  (1 unrouted)
  Top 0.406: R1.1 26.86,18.54 30.1,18.54 | R11.1 34.54,22.99 30.1,18.54 | 31.11,17.14 31.11,17.53 30.1,18.54
TRIG-OUT1  (via drill 0.61)
  Top 0.406: JP13.2 55.12,31.5 51.44,27.81 v50.55,27.81 | v34.04,19.81 32.64,18.41 32.64,15.37 32.51,15.37 30.73,13.59 30.73,8.26 28.19,5.71 R14.1 27.98,3.05 25.78,3.05 v25.02,2.29 | v1.78,8.76 R12.1
  Bottom 0.406: v25.02,2.29 23.79,2.33 6.69,2.33 4.83,4.19 4.83,5.71 v1.78,8.76 | v50.55,27.81 50.42,27.81 45.09,22.48 45.09,21.46 43.31,19.68 34.16,19.68 arc-90 v34.04,19.81
TRIG-OUT2  (via drill 0.61)
  Top 0.406: R15.1 34.46,12.41 v34.42,12.45 34.54,12.32 37.08,12.32 37.76,11.64 R13.1 | v44.07,16.51 44.07,19.68 50.16,25.78 55.75,25.78 57.4,27.43 57.4,28.83 JP13.1
  Bottom 0.406: v34.42,12.45 34.54,12.45 37.47,15.37 42.93,15.37 v44.07,16.51
VCC  (via drill 0.61)
  Top 0.61: JP8.4 56.64,96.65 52.58,92.58 52.58,69.72 v50.29,67.44 | v45.72,67.44 34.8,56.52 34.8,42.8 32.77,40.77 32.77,37.85 | 32.77,37.85 32.77,36.45 31.88,35.56 IC1.8 | C5.1 31.96,37.85 32.77,37.85
  Bottom 0.61: v50.29,67.44 v45.72,67.44
VEE  (via drill 0.61)
  Top 0.406: C6.2 26.84,31.52 IC1.4
  Top 0.61: JP8.3 54.61,91.44 v54.61,88.14 | v41.78,88.14 41.78,65.79 26.29,50.29 v26.29,43.82 | v26.29,39.12 29.08,36.32 29.08,32.77 28.07,31.75 IC1.4
  Bottom 0.61: v54.61,88.14 v41.78,88.14 | v26.29,39.12 v26.29,43.82

### Text on the board
bNames: CONTROL BOARD V1.0